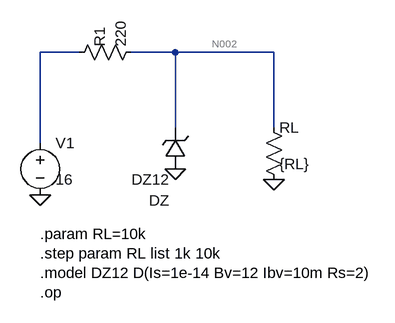
[diagram p0: schematic Ex06.asc]
Ex06.asc, the LTspice schematic file:
Version 4
SHEET 1 880 680
WIRE 60 200 60 60
WIRE 60 60 120 60
WIRE 200 60 268 60
WIRE 268 60 268 176
WIRE 268 60 420 60
WIRE 420 60 420 176
FLAG 60 280 0
FLAG 268 240 0
FLAG 420 256 0
SYMBOL voltage 60 184 R0
WINDOW 0 24 16 Left 2
WINDOW 3 24 72 Left 2
SYMATTR InstName V1
SYMATTR Value 16
SYMBOL res 104 76 R270
WINDOW 0 24 48 Left 2
WINDOW 3 24 80 Left 2
SYMATTR InstName R1
SYMATTR Value 220
SYMBOL zener 284 240 R180
WINDOW 0 24 -48 Left 2
WINDOW 3 24 -16 Left 2
SYMATTR InstName DZ
SYMATTR Value DZ12
SYMBOL res 404 160 R0
WINDOW 0 24 16 Left 2
WINDOW 3 24 72 Left 2
SYMATTR InstName RL
SYMATTR Value {RL}
TEXT 60 340 Left 2 !.param RL=10k
TEXT 60 370 Left 2 !.step param RL list 1k 10k
TEXT 60 400 Left 2 !.model DZ12 D(Is=1e-14 Bv=12 Ibv=10m Rs=2)
TEXT 60 430 Left 2 !.op

The netlist it stands for:
* Ex06.asc
V1 N001 0 16
R1 N001 N002 220
DZ 0 N002 DZ12
RL N002 0 {RL}
.model D D
.lib standard.dio
.param RL=10k
.step param RL list 1k 10k
.model DZ12 D(Is=1e-14 Bv=12 Ibv=10m Rs=2)
.op
.backanno
.end

* Results of the author's LTspice run, read from the files saved beside the schematic
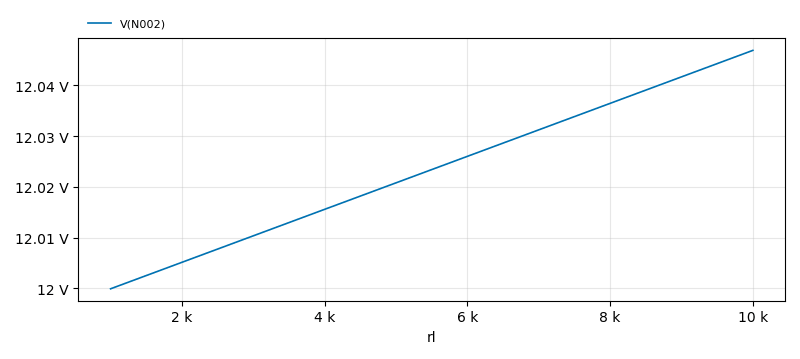
[diagram p1: Operating Point of Ex06.asc, plotted from the saved traces]
* Operating Point, 1 run:
*   V(N002): 12 V at rl=1 k, 12.05 V at rl=10 k, min 12 V, max 12.05 V